# Altium schematic sheet SENSE_BREAK.SchDoc
size 558 x 431 mm; SheetNumber: 4; SheetTotal: 6
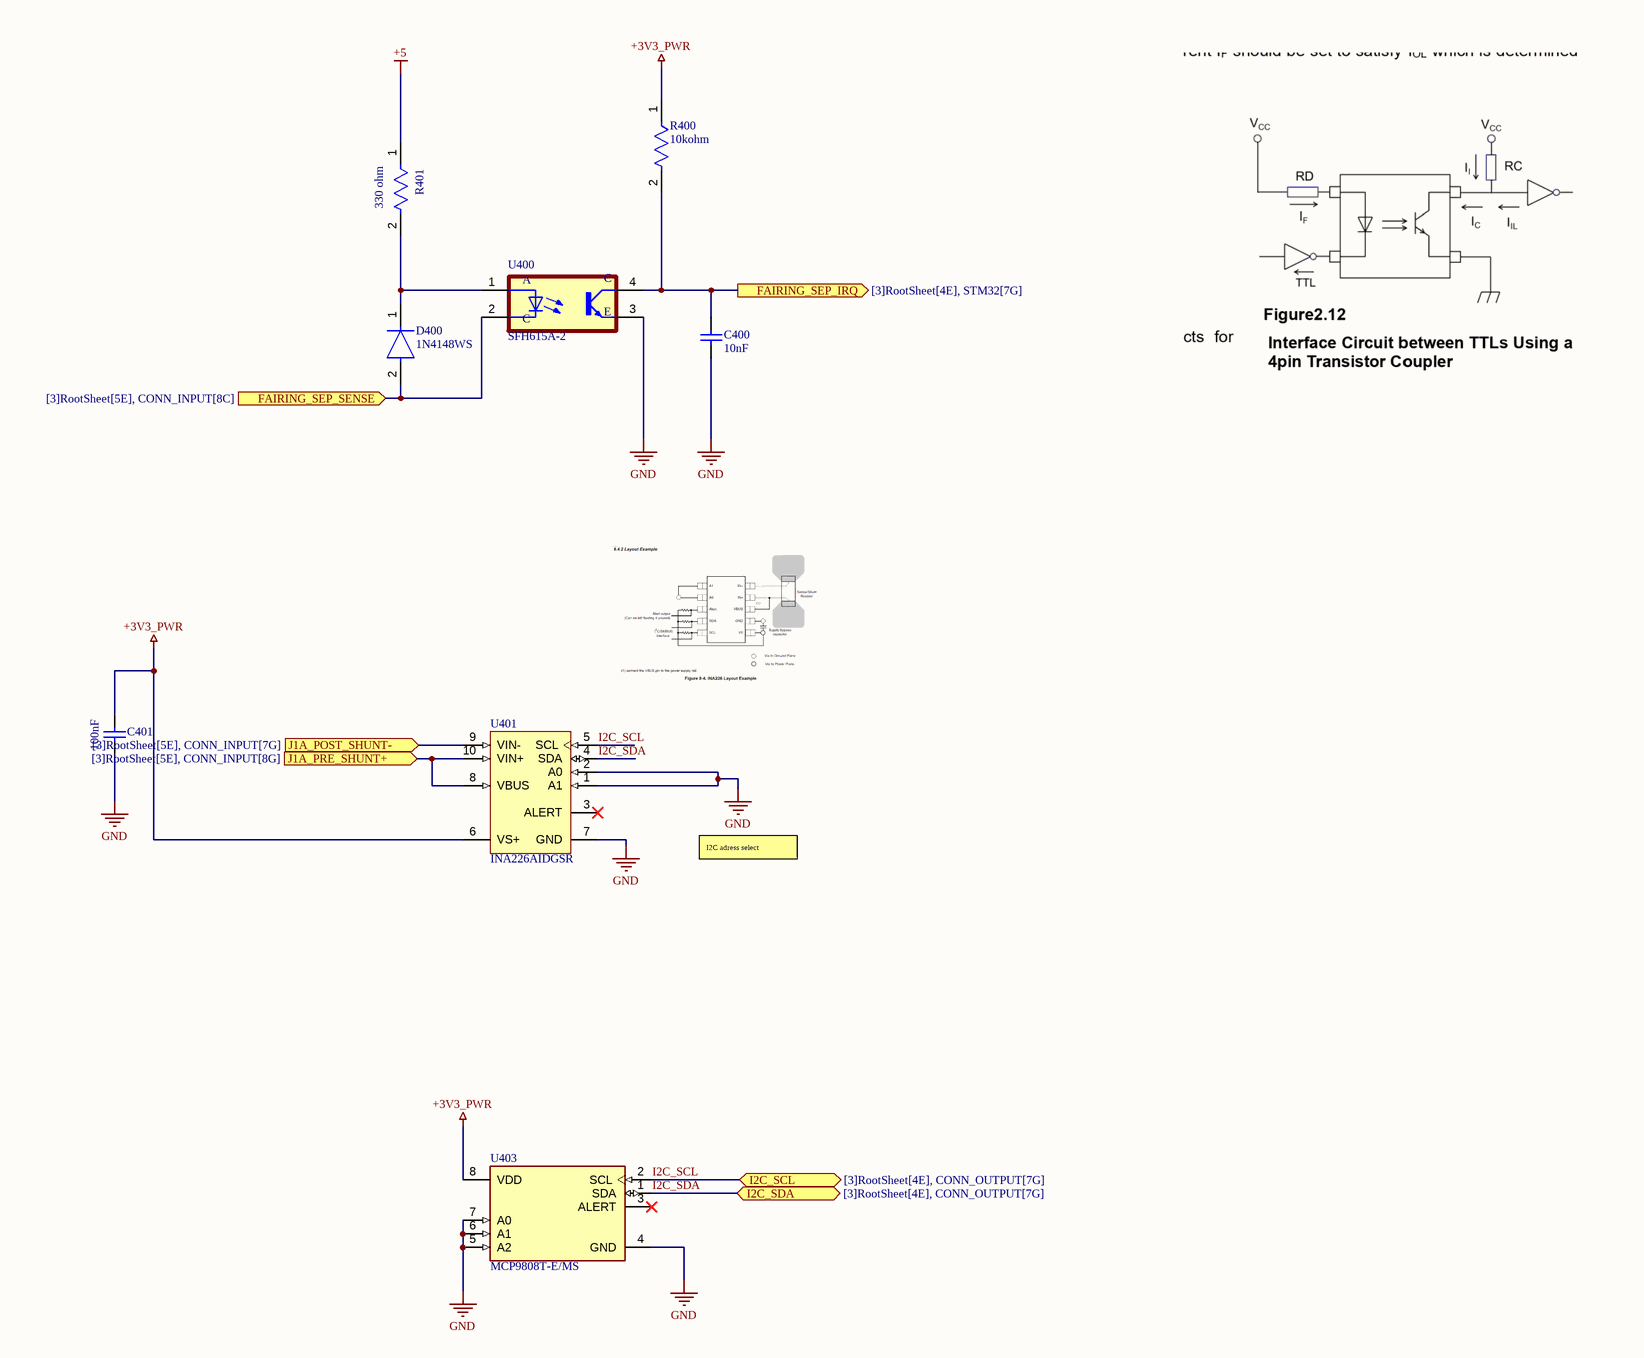
[diagram p0: SENSE_BREAK.SchDoc]

## Parts
C400  10nF  [CAPC1608X90X35LL10T15]
C401  100nF  [CAPC1608X90X35ML10T15]
D400  1N4148WS  [FP-477AB-IPC_C]
R400  10kohm  [FP-RC0603-0_55-IPC_C]
R401  330 ohm  [FP-CRCW0805-e3-MFG]
U400  SFH615A-2  [DIP762W50P254L458H480Q4]
U401  INA226AIDGSR  [DGS0010A_L]
U403  MCP9808T-E/MS  [FP-C04-111-MFG]

## Ports
FAIRING_SEP_IRQ (out, see [3]RootSheet[4E], STM32[7G]), FAIRING_SEP_SENSE (in, see [3]RootSheet[5E], CONN_INPUT[8C]), I2C_SCL (bidir, see [3]RootSheet[4E], CONN_OUTPUT[7G]), I2C_SDA (bidir, see [3]RootSheet[4E], CONN_OUTPUT[7G]), J1A_POST_SHUNT- (in, see [3]RootSheet[5E], CONN_INPUT[7G]), J1A_PRE_SHUNT+ (in, see [3]RootSheet[5E], CONN_INPUT[8G])

## Nets
+3V3_PWR: C401.2 R400.1 U401.6(VS+) U403.8(VDD)
+5: R401.1
GND: C400.1 C401.1 U400.3(E) U401.1(A1) U401.2(A0) U401.7(GND) U403.4(GND) U403.5(A2) U403.6(A1) U403.7(A0)
FAIRING_SEP_IRQ: C400.2 R400.2 U400.4(CO) ; port FAIRING_SEP_IRQ
FAIRING_SEP_SENSE: D400.2(A) U400.2(C) ; port FAIRING_SEP_SENSE
I2C_SCL: U401.5(SCL) U403.2(SCL) ; port I2C_SCL
I2C_SDA: U401.4(SDA) U403.1(SDA) ; port I2C_SDA
J1A_POST_SHUNT-: U401.9(VIN-) ; port J1A_POST_SHUNT-
J1A_PRE_SHUNT+: U401.8(VBUS) U401.10(VIN+) ; port J1A_PRE_SHUNT+
NetD400_1: D400.1(C) R401.2 U400.1(A)

Not connected (* = marked no-connect by the designer): U401 3(ALERT)*; U403 3(ALERT)*

## Notes on the sheet
- I2C adress select
- DWG. NO.
- REV.
- SHT.
- REVISION
- DESCRIPTION
- DATE
- APPROVED
- THIS DOCUMENT AND THE DATA DISCLOSED HEREIN OR HEREWITH IS THE PROPERTY OF ALTIUM LIMITED AND MAY BE FREELY DISTRIBUTED IN WHOLE. NO RIGHTS ARE RESERVED OR EXPRESS OR IMPLIED WARANTEE GIVEN.
- ENG:
- DSN:
- APPROVALS
- PROJECT
- DOCUMENT REVISION:
- DESIGN ITEM:
- CHK:
- BOM:
- REFERENCE DOCUMENTS
- PROJECT REVISION:
- TITLE
- FAB DWG:
- PCB DWG:
- ASSY DWG:
- SCALE:
- SIZE
- C
- CAGE CODE
- FILE NAME
- DWG NO.
- SHEET
- OF
- REV

## Library data of the parts
C400 = CMP-2006-02373-1: Part Number: GCM188R71H103KA37D; Manufacturer: Murata
C401 = CMP-2006-02375-5: Chip Capacitor, 100 nF, +/- 10%, 50 V, -55 to 125 degC, 0603 (1608 Metric), RoHS, Tape and Reel; Manufacturer: Murata; Voltage Rating: 50 V; Min Operating Temperature: -55 degC; ComponentLink1URL: http://www.murata.com/; PackageReference: 0603; Max Operating Temperature: 125 degC; ComponentLink1Description: Manufacturer URL; ComponentLink2Description: Datasheet; Packaging: Tape and Reel; PackageDescription: 2-Pin Surface Mount Device, Body 1.6 x 0.8 mm; Height: 0.8 mm; Mounting Technology: Surface Mount; Mount: Surface Mount; Length: 1.6 mm; ComponentLink2URL: http://psearch.en.murata.com/capacitor/product/GCM188R71H104KA57%23.pdf; Package Quantity: 4000; REACH SVHC: No SVHC; RoHSCompliant: true; DatasheetVersion: 07/2016
D400 = CMP-07163-000040-1: DIODE GEN PURP 75V 150MA SOD323F; Forward Voltage: 1V; Power Dissipation: 200mW; Element Configuration: Single; Max Forward Surge Current (Ifsm): 2A; Peak Reverse Current: 5uA; Recovery Time: 4ns; Package Quantity: 1; Number of Pins: 2; Height: 1mm; REACH SVHC: No SVHC; Max Reverse Voltage (DC): 75V; Forward Current: 150mA; Length: 1.8mm; Max Repetitive Reverse Voltage (Vrrm): 75V; Max Operating Temperature: 150°C; Average Rectified Current: 150mA; Contact Plating: Tin; Packaging: Tape and Reel; Radiation Hardening: No; Min Operating Temperature: -55°C; Width: 1.35mm; Weight: 0.0276g; Lead Free: Lead Free; Mount: Surface Mount; Reverse Voltage: 75V; Reverse Recovery Time: 4ns
R400 = CMP-2100-03664-2: RES 10K OHM 1% 1/10W 0603; Voltage Rating: 75V; Voltage Rating (DC): 50V; Resistance: 10kR; Power Rating: 100mW; Temperature Coefficient: 100ppm/°C; Depth: 0.8mm; Termination: SMD/SMT; Resistor Type: Thick Film; Series: RC; Construction: Rectangular; Features: Moisture Resistant; Packaging: Tape and Reel; Min Operating Temperature: -55°C; Number of Terminations: 2; Lead Pitch: 0.3mm; RoHS Compliant: Yes; Case/Package: 0603; Resistance Tolerance: 1%; Military Standard: Not; Weight: 7.1E-05oz; Number of Pins: 2; Tolerance: 1%; Length: 1.6mm; Case Code (Imperial): 0603; Lead Free: Lead Free; Width: 0.8mm; Max Power Dissipation: 100mW; Height: 0.45mm; Max Operating Temperature: 155°C; Case Code (Metric): 1608; Size Code: 0603
R401 = CMP-2001-03823-2: RES Thick Film, 330Ω, 1%, 0.125W, 100ppm/°C, 0805; Voltage Rating (DC): 150V; Resistance: 330R; Max Power Dissipation: 125mW; Mount: Surface Mount; Packaging: Tape and Reel; Min Operating Temperature: -55°C; Military Standard: Not; Case Code (Metric): 2012; Height: 0.02inch; Voltage Rating: 150V; Case/Package: 0805; Max Operating Temperature: 155°C; Width: 0.049inch; Case Code (Imperial): 0805; Termination: SMD/SMT; Lead Free: Lead Free; Contact Plating: Tin; Package Quantity: 10; Composition: Thick Film; Length: 2mm; Features: Automotive AEC-Q200; Depth: 1.25mm; Weight: 0.000194oz; Tolerance: 1%; Power Rating: 125mW; Number of Terminations: 2; Temperature Coefficient: 100ppm/°C
U400 = SFH615A-2: Optocoupler, 1.25 V (Typ.), 60 mA (Max.), 5300 V (RMS) (Max.), 100 mW (Max.) | Vishay / Small Signal & Opto Products (SSP) SFH615A-2; MF: Vishay Semiconductor; SnapEDA_Link: https://www.snapeda.com/parts/SFH615A-2/Vishay/view-part/?ref=snap; Package: DIP-4 Vishay; Value: *; MP: SFH615A-2; Check_prices: https://www.snapeda.com/parts/SFH615A-2/Vishay/view-part/?ref=eda
U401 = CMP-0704-00058-2: High-Side Measurement, Bi-Directional Current / Power Monitor with I2C Interface, 2.7 to 5.5 V, -40 to 125 degC, 10-pin SOP (DGS10), Green (RoHS & no Sb/Br); Vs(Max)(V): 5.5; CMRR(Min)(dB): 126; Rating: Catalog; Input Offset (+/-)(Max)(uV): 10; Small-Signal Bandwidth(Typ)(MHz): 0.007; Input Offset Drift (+/-)(Max)(uV/Degrees Celsius): 0.1; Common Mode Range(Max)(V): 36; Gain(V/V): 1; SubFamily: Current Shunt Monitor; Quiescent Current (+/-)(Typ)(mA): 0.33; Vs(Min)(V): 2.7; Common Mode Range(Min)(V): 0; ComponentLink2URL: http://www.ti.com/general/docs/lit/getliterature.tsp?genericPartNumber=INA226&fileType=pdf; ComponentLink1URL: http://www.ti.com/; PartNumber: INA226AIDGSR; Mounting Technology: Surface Mount; PackageDescription: 10-Pin Plastic Small Outline, Body 3 x 3 mm, Pitch 0.5 mm; ComponentLink3Description: Package Specification; Code_JEDEC: MO-153; Eco-Plan: Green (RoHS & no Sb/Br); PackageReference: DGS0010A; ComponentLink2Description: Datasheet; ComponentLink3URL: http://www.ti.com/lit/ml/mpds035b/mpds035b.pdf; ComponentLink1Description: Manufacturer URL; DatasheetVersion: SBOS547; PackageVersion: 4073272/C, 02/2004
U403 = CMP-0192-00343-2: SENSOR DIGITAL -40C-125C 8MSOP; Interface: I2C; Operating Supply Current: 200uA; Resolution: 10b; Min Supply Voltage: 2.7V; Max Supply Voltage (DC): 5.5V; Width: 3mm; Height: 0.95mm; Package Quantity: 2500; Length: 3mm; Lead Free: Lead Free; Radiation Hardening: No; Number of Pins: 8; Min Supply Voltage (DC): 2.7V; Output Type: Digital; Packaging: Tape and Reel; Max Supply Voltage: 5.5V; Max Operating Temperature: 125°C; Case/Package: MSOP; Min Operating Temperature: -40°C